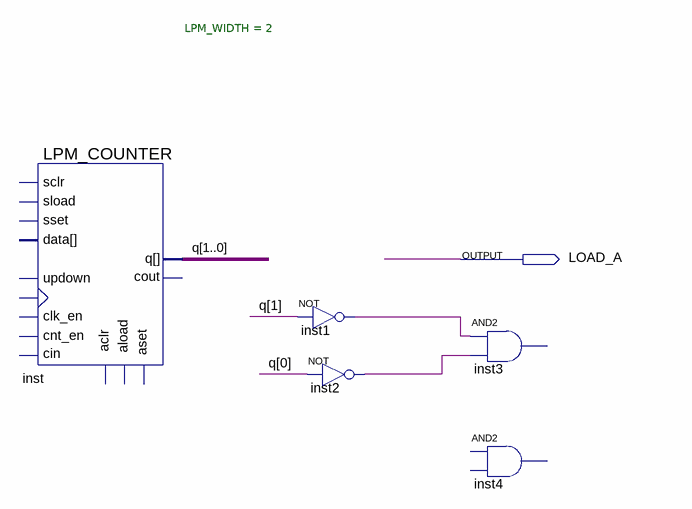
[diagram p0: schematic sheet]
// Quartus schematic unidade_controle.bdf as structural Verilog: 5 symbols, 1 pins
module unidade_controle (
  output LOAD_A
);

  wire inst1_out, inst2_out;
  wire [1:0] q;

  LPM_COUNTER #(.LPM_WIDTH(2)) inst (.q(q));  // open: sload, data, clock, clk_en, aload, aclr, aset, cin, sset, updown, cnt_en, sclr, cout
  not inst1 (inst1_out, q[1]);
  not inst2 (inst2_out, q[0]);
  // AND2 inst3 has open pins: IN1=inst1_out, IN2=inst2_out, OUT=open
  // AND2 inst4 is placed but not wired
endmodule
